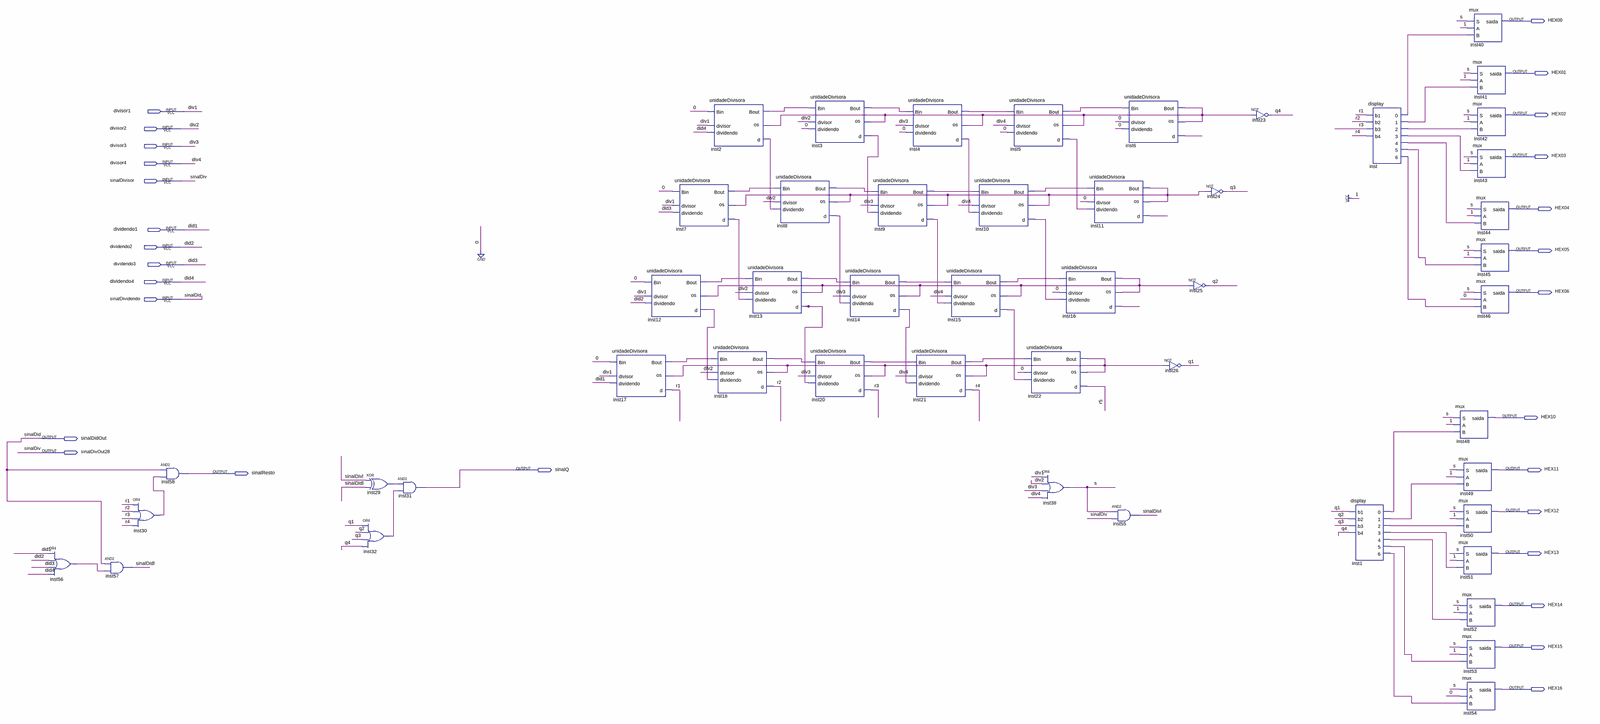
[diagram p0: schematic sheet, whole]
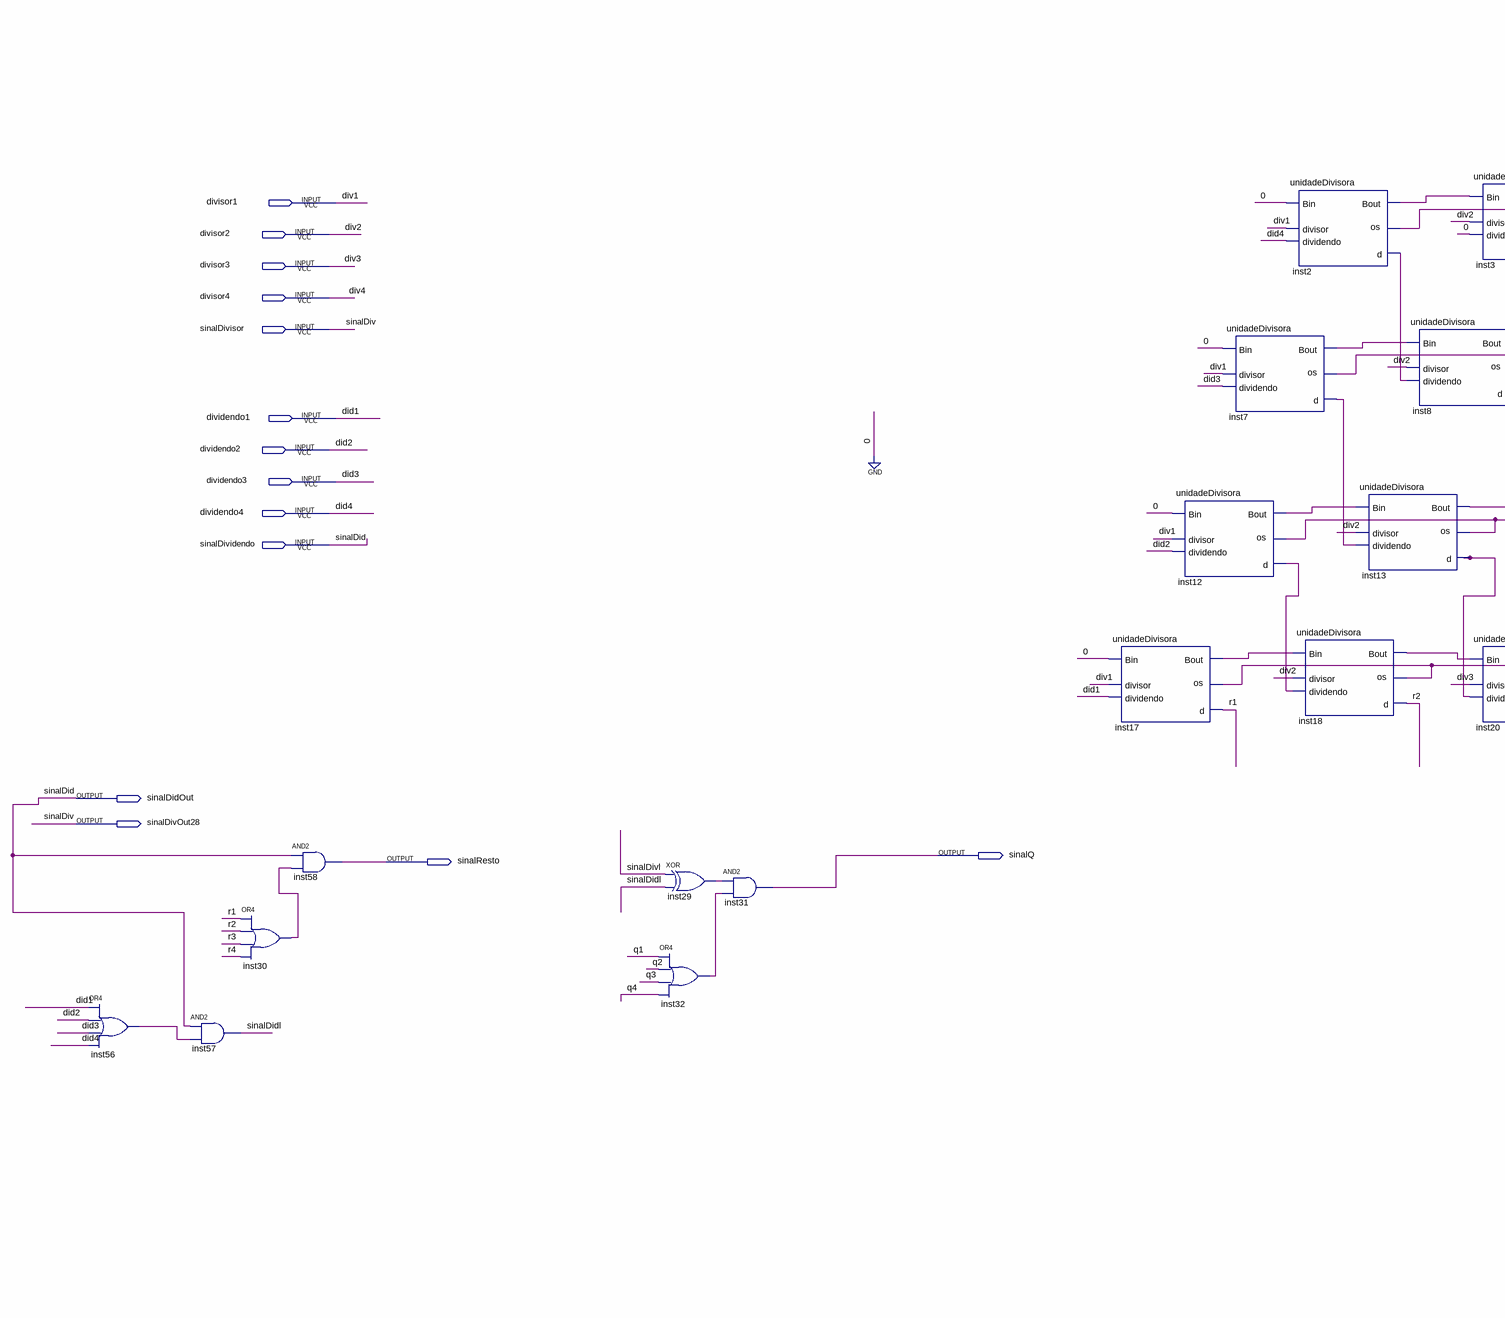
[diagram p1: schematic sheet, left part]
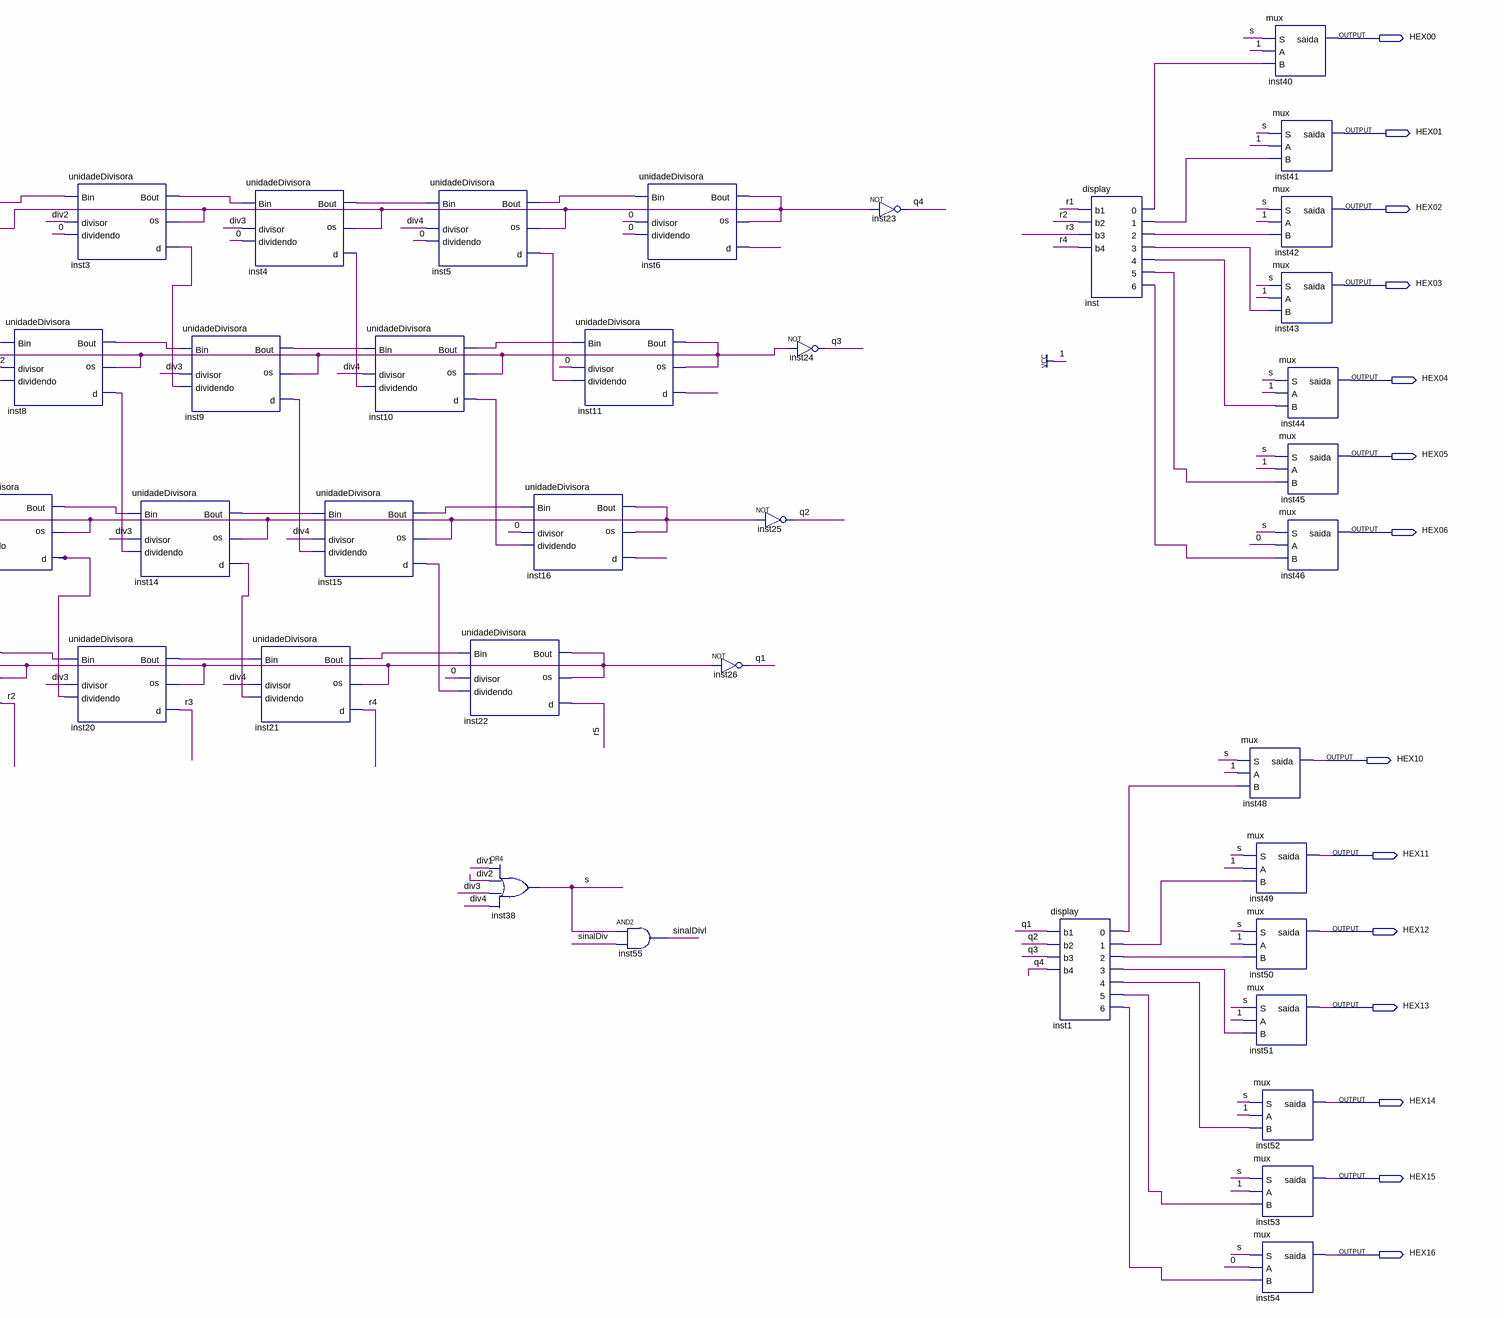
[diagram p2: schematic sheet, right part]
// Quartus schematic aula11.bdf as structural Verilog: 49 symbols, 28 pins
module aula11 (
  input  divisor1,
  input  divisor2,
  input  divisor3,
  input  divisor4,
  input  sinalDivisor,
  input  dividendo1,
  input  dividendo2,
  input  dividendo3,
  input  dividendo4,
  input  sinalDividendo,
  output HEX00,
  output HEX01,
  output HEX02,
  output HEX03,
  output HEX04,
  output HEX05,
  output HEX06,
  output HEX10,
  output sinalDidOut,
  output sinalDivOut28,
  output sinalQ,
  output HEX11,
  output sinalResto,
  output HEX12,
  output HEX13,
  output HEX14,
  output HEX15,
  output HEX16
);

  wire inst1_0, inst1_1, inst1_2, inst1_3, inst1_4, inst1_5, inst1_6, inst2_bout, inst2_d, inst3_bout,
       inst3_d, inst4_bout, inst4_d, inst5_bout, inst5_d, inst6_bout, inst6_d, inst7_bout, inst7_d,
       inst8_bout, inst8_d, inst9_bout, inst9_d, inst10_bout, inst10_d, inst11_bout, inst11_d, inst12_bout,
       inst12_d, inst13_bout, inst13_d, inst14_bout, inst14_d, inst15_bout, inst15_d, inst16_bout, inst16_d,
       inst17_bout, inst18_bout, inst20_bout, inst21_bout, inst22_bout, inst29_out, inst30_out, inst32_out,
       inst56_out, inst_0, inst_1, inst_2, inst_3, inst_4, inst_5, inst_6, q1, q2, q3, q4, r1, r2, r3, r4,
       r5, s, sinalDidl, sinalDivl;

  or inst56 (inst56_out, dividendo1, dividendo2, dividendo3, dividendo4);
  and inst57 (sinalDidl, sinalDividendo, inst56_out);
  or inst30 (inst30_out, r1, r2, r3, r4);
  and inst58 (sinalResto, sinalDividendo, inst30_out);
  xor inst29 (inst29_out, sinalDivl, sinalDidl);
  or inst32 (inst32_out, q1, q2, q3, q4);
  and inst31 (sinalQ, inst29_out, inst32_out);
  unidadeDivisora inst17 (
    .Bin(1'b0), .divisor(divisor1), .dividendo(dividendo1), .os(inst22_bout), .Bout(inst17_bout), .d(r1));
  unidadeDivisora inst12 (
    .Bin(1'b0), .divisor(divisor1), .dividendo(dividendo2), .os(inst16_bout), .Bout(inst12_bout), .d(inst12_d));
  unidadeDivisora inst7 (
    .Bin(1'b0), .divisor(divisor1), .dividendo(dividendo3), .os(inst11_bout), .Bout(inst7_bout), .d(inst7_d));
  unidadeDivisora inst2 (
    .Bin(1'b0), .divisor(divisor1), .dividendo(dividendo4), .os(inst6_bout), .Bout(inst2_bout), .d(inst2_d));
  unidadeDivisora inst18 (
    .Bin(inst17_bout), .divisor(divisor2), .dividendo(inst12_d), .os(inst22_bout), .Bout(inst18_bout), .d(r2));
  unidadeDivisora inst13 (
    .Bin(inst12_bout), .divisor(divisor2), .dividendo(inst7_d), .os(inst16_bout), .Bout(inst13_bout),
    .d(inst13_d));
  unidadeDivisora inst8 (
    .Bin(inst7_bout), .divisor(divisor2), .dividendo(inst2_d), .os(inst11_bout), .Bout(inst8_bout),
    .d(inst8_d));
  unidadeDivisora inst3 (
    .Bin(inst2_bout), .divisor(divisor2), .dividendo(1'b0), .os(inst6_bout), .Bout(inst3_bout), .d(inst3_d));
  unidadeDivisora inst20 (
    .Bin(inst18_bout), .divisor(divisor3), .dividendo(inst13_d), .os(inst22_bout), .Bout(inst20_bout), .d(r3));
  unidadeDivisora inst14 (
    .Bin(inst13_bout), .divisor(divisor3), .dividendo(inst8_d), .os(inst16_bout), .Bout(inst14_bout),
    .d(inst14_d));
  unidadeDivisora inst9 (
    .Bin(inst8_bout), .divisor(divisor3), .dividendo(inst3_d), .os(inst11_bout), .Bout(inst9_bout),
    .d(inst9_d));
  unidadeDivisora inst4 (
    .Bin(inst3_bout), .divisor(divisor3), .dividendo(1'b0), .os(inst6_bout), .Bout(inst4_bout), .d(inst4_d));
  unidadeDivisora inst21 (
    .Bin(inst20_bout), .divisor(divisor4), .dividendo(inst14_d), .os(inst22_bout), .Bout(inst21_bout), .d(r4));
  unidadeDivisora inst15 (
    .Bin(inst14_bout), .divisor(divisor4), .dividendo(inst9_d), .os(inst16_bout), .Bout(inst15_bout),
    .d(inst15_d));
  unidadeDivisora inst10 (
    .Bin(inst9_bout), .divisor(divisor4), .dividendo(inst4_d), .os(inst11_bout), .Bout(inst10_bout),
    .d(inst10_d));
  unidadeDivisora inst5 (
    .Bin(inst4_bout), .divisor(divisor4), .dividendo(1'b0), .os(inst6_bout), .Bout(inst5_bout), .d(inst5_d));
  unidadeDivisora inst22 (
    .Bin(inst21_bout), .divisor(1'b0), .dividendo(inst15_d), .os(inst22_bout), .Bout(inst22_bout), .d(r5));
  unidadeDivisora inst16 (
    .Bin(inst15_bout), .divisor(1'b0), .dividendo(inst10_d), .os(inst16_bout), .Bout(inst16_bout),
    .d(inst16_d));
  or inst38 (s, divisor1, divisor2, divisor3, divisor4);
  unidadeDivisora inst11 (
    .Bin(inst10_bout), .divisor(1'b0), .dividendo(inst5_d), .os(inst11_bout), .Bout(inst11_bout), .d(inst11_d));
  and inst55 (sinalDivl, s, sinalDivisor);
  unidadeDivisora inst6 (
    .Bin(inst5_bout), .divisor(1'b0), .dividendo(1'b0), .os(inst6_bout), .Bout(inst6_bout), .d(inst6_d));
  not inst26 (q1, inst22_bout);
  not inst25 (q2, inst16_bout);
  not inst24 (q3, inst11_bout);
  not inst23 (q4, inst6_bout);
  display inst (
    .b1(r1), .b2(r2), .b3(r3), .b4(r4), .\0 (inst_0), .\1 (inst_1), .\2 (inst_2), .\3 (inst_3), .\4 (inst_4),
    .\5 (inst_5), .\6 (inst_6));
  display inst1 (
    .b1(q1), .b2(q2), .b3(q3), .b4(q4), .\0 (inst1_0), .\1 (inst1_1), .\2 (inst1_2), .\3 (inst1_3),
    .\4 (inst1_4), .\5 (inst1_5), .\6 (inst1_6));
  mux inst48 (.S(s), .A(1'b1), .B(inst1_0), .saida(HEX10));
  mux inst40 (.S(s), .A(1'b1), .B(inst_0), .saida(HEX00));
  mux inst41 (.S(s), .A(1'b1), .B(inst_1), .saida(HEX01));
  mux inst42 (.S(s), .A(1'b1), .B(inst_2), .saida(HEX02));
  mux inst43 (.S(s), .A(1'b1), .B(inst_3), .saida(HEX03));
  mux inst44 (.S(s), .A(1'b1), .B(inst_4), .saida(HEX04));
  mux inst45 (.S(s), .A(1'b1), .B(inst_5), .saida(HEX05));
  mux inst46 (.S(s), .A(1'b0), .B(inst_6), .saida(HEX06));
  mux inst49 (.S(s), .A(1'b1), .B(inst1_1), .saida(HEX11));
  mux inst50 (.S(s), .A(1'b1), .B(inst1_2), .saida(HEX12));
  mux inst51 (.S(s), .A(1'b1), .B(inst1_3), .saida(HEX13));
  mux inst52 (.S(s), .A(1'b1), .B(inst1_4), .saida(HEX14));
  mux inst53 (.S(s), .A(1'b1), .B(inst1_5), .saida(HEX15));
  mux inst54 (.S(s), .A(1'b0), .B(inst1_6), .saida(HEX16));

  assign sinalDidOut = sinalDividendo;
  assign sinalDivOut28 = sinalDivisor;

  // Other names for the same wires on the sheet: did1 = dividendo1; did2 = dividendo2; did3 = dividendo3;
  //   did4 = dividendo4; div1 = divisor1; div2 = divisor2; div3 = divisor3; div4 = divisor4;
  //   sinalDid = sinalDividendo; sinalDiv = sinalDivisor
endmodule
